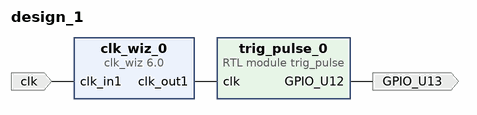
[diagram p0: block diagram of the top level]
# Vivado block design design_1, xc7z020clg400-1, Vivado 2023.1
create_bd_design design_1

create_bd_port -dir I clk
create_bd_port -dir O GPIO_U13

create_bd_cell -type module -reference trig_pulse trig_pulse_0
create_bd_cell -type ip -vlnv xilinx.com:ip:clk_wiz:6.0 clk_wiz_0

# ---- connections ----

connect_bd_net [get_bd_ports clk] [get_bd_pins clk_wiz_0/clk_in1]
connect_bd_net [get_bd_pins clk_wiz_0/clk_out1] [get_bd_pins trig_pulse_0/clk]
connect_bd_net [get_bd_pins trig_pulse_0/GPIO_U12] [get_bd_ports GPIO_U13]

validate_bd_design
save_bd_design
